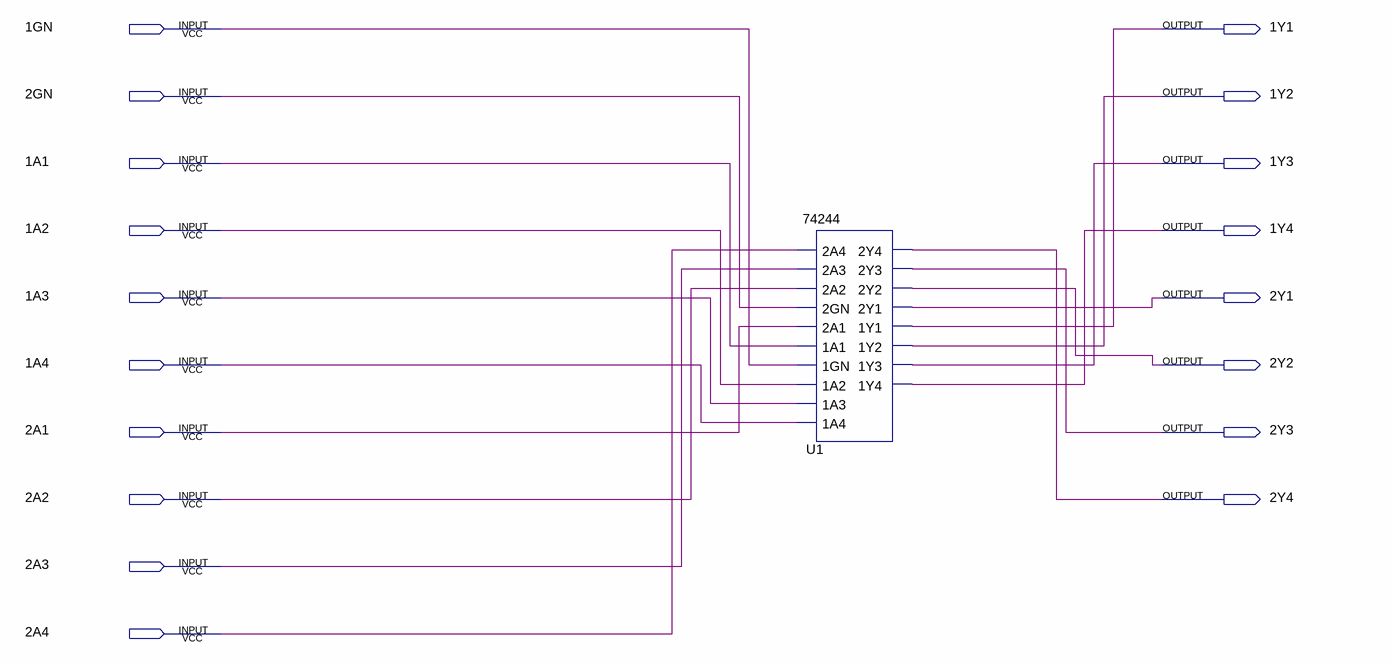
[diagram p0: schematic sheet]
// Quartus schematic probe_tri.bdf as structural Verilog: 1 symbols, 18 pins
module probe_tri (
  input  \1GN ,
  input  \2GN ,
  input  \1A1 ,
  input  \1A2 ,
  input  \1A3 ,
  input  \1A4 ,
  input  \2A1 ,
  input  \2A2 ,
  input  \2A3 ,
  input  \2A4 ,
  output \1Y1 ,
  output \1Y2 ,
  output \1Y3 ,
  output \1Y4 ,
  output \2Y1 ,
  output \2Y2 ,
  output \2Y3 ,
  output \2Y4 
);

  \74244  U1 (
    .\2A4 (\2A4 ), .\2A3 (\2A3 ), .\2A2 (\2A2 ), .\2GN (\2GN ), .\2A1 (\2A1 ), .\1A1 (\1A1 ), .\1GN (\1GN ),
    .\1A2 (\1A2 ), .\1A3 (\1A3 ), .\1A4 (\1A4 ), .\2Y4 (\2Y4 ), .\2Y3 (\2Y3 ), .\2Y2 (\2Y2 ), .\2Y1 (\2Y1 ),
    .\1Y1 (\1Y1 ), .\1Y2 (\1Y2 ), .\1Y3 (\1Y3 ), .\1Y4 (\1Y4 ));
endmodule
